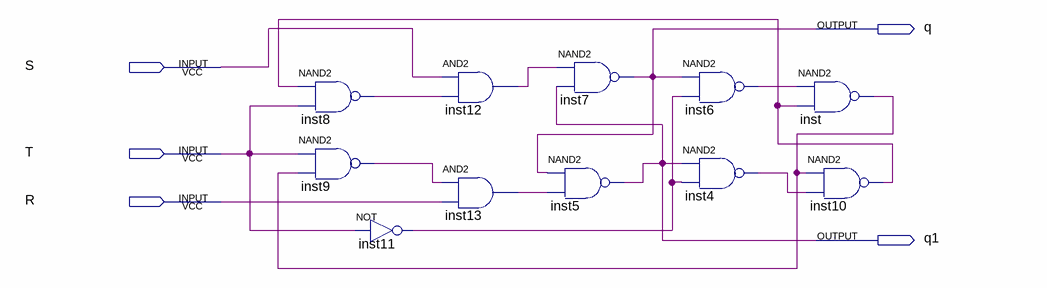
[diagram p0: schematic sheet]
// Quartus schematic TRS.bdf as structural Verilog: 11 symbols, 5 pins
module TRS (
  input  S,
  input  T,
  input  R,
  output q,
  output q1
);

  wire inst4_out, inst6_out, inst8_out, inst9_out, inst10_out, inst11_out, inst12_out, inst13_out, inst_out;

  nand inst8 (inst8_out, inst10_out, T);
  nand inst9 (inst9_out, T, inst_out);
  not inst11 (inst11_out, T);
  and inst12 (inst12_out, S, inst8_out);
  and inst13 (inst13_out, inst9_out, R);
  nand inst7 (q, inst12_out, q1);
  nand inst5 (q1, q, inst13_out);
  nand inst6 (inst6_out, q, inst11_out);
  nand inst4 (inst4_out, q1, inst11_out);
  nand inst (inst_out, inst6_out, inst10_out);
  nand inst10 (inst10_out, inst_out, inst4_out);
endmodule
